# Altium project Module Board.PrjPcb (part 2 of 2)

## Sheet ESP_32.SchDoc
size A4; SheetNumber: 2; SheetTotal: 6
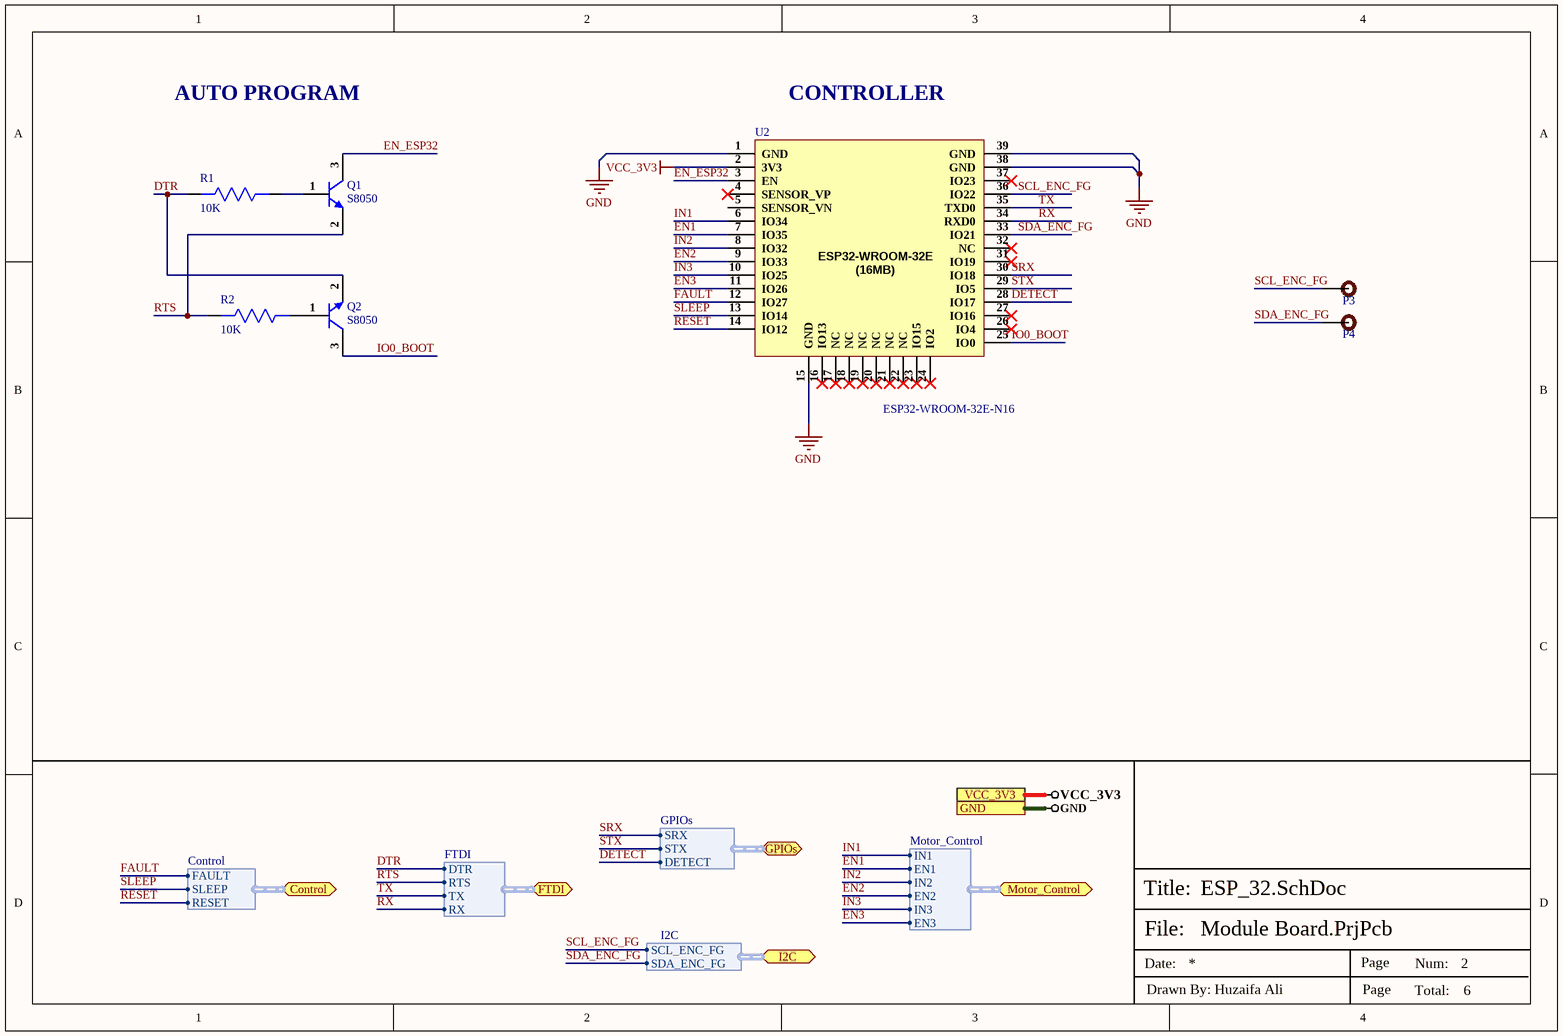
[diagram p3: ESP_32.SchDoc]

### Parts
P3  TEST POINT  [Test-point]  (value not drawn)
P4  TEST POINT  [Test-point]  (value not drawn)
Q1  S8050  [SOT-23]
Q2  S8050  [SOT-23]
R1  10K  [Res-0603]
R2  10K  [Res-0603]
U2  ESP32-WROOM-32E-N16  [38-SMD Module]

### Ports
Control (bidir, harness Control), FTDI (bidir, harness FTDI), GND, GPIOs (bidir, harness GPIOs), I2C (bidir, harness I2C), Motor_Control (bidir, harness Motor_Control), VCC_3V3

### Harnesses
Motor_Control: IN1, EN1, IN2, EN2, IN3, EN3
Control: FAULT, SLEEP, RESET
FTDI: DTR, TX, RX, RTS
I2C: SCL_ENC_FG, SDA_ENC_FG
GPIOs: SRX, STX, DETECT

### Nets
GND: U2.1(GND) U2.15(GND) U2.38(GND) U2.39(GND) ; port GND
VCC_3V3: U2.2(3V3) ; port VCC_3V3
DETECT: U2.28(IO17) ; port GPIOs.DETECT
DTR: Q2.2(E) R1.2 ; port FTDI.DTR
EN1: U2.7(IO35) ; port Motor_Control.EN1
EN2: U2.9(IO33) ; port Motor_Control.EN2
EN3: U2.11(IO26) ; port Motor_Control.EN3
EN_ESP32: Q1.3(C) U2.3(EN)
FAULT: U2.12(IO27) ; port Control.FAULT
IN1: U2.6(IO34) ; port Motor_Control.IN1
IN2: U2.8(IO32) ; port Motor_Control.IN2
IN3: U2.10(IO25) ; port Motor_Control.IN3
IO0_BOOT: Q2.3(C) U2.25(IO0)
RESET: U2.14(IO12) ; port Control.RESET
RTS: Q1.2(E) R2.2 ; port FTDI.RTS
RX: U2.34(RXD0) ; port FTDI.RX
SCL_ENC_FG: P3.1 U2.36(IO22) ; port I2C.SCL_ENC_FG
SDA_ENC_FG: P4.1 U2.33(IO21) ; port I2C.SDA_ENC_FG
SLEEP: U2.13(IO14) ; port Control.SLEEP
SRX: U2.30(IO18) ; port GPIOs.SRX
STX: U2.29(IO5) ; port GPIOs.STX
TX: U2.35(TXD0) ; port FTDI.TX
NetQ1_1: Q1.1(B) R1.1
NetQ2_1: Q2.1(B) R2.1

Not connected (* = marked no-connect by the designer): U2 4(SENSOR_VP)* 5(SENSOR_VN) 16(IO13)* 17(NC)* 18(NC)* 19(NC)* 20(NC)* 21(NC)* 22(NC)* 23(IO15)* 24(IO2)* 26(IO4)* 27(IO16)* 31(IO19)* 32(NC)* 37(IO23)*

### Notes on the sheet
- AUTO PROGRAM
- (near U2) CONTROLLER
- File:
- Title:
- Date:
- Page
- Num:
- Total:
- Drawn By: Huzaifa Ali
- (in symbol ESP32-WROOM-32E-N16) ESP32-WROOM-32E (16MB) /

### Library data of the parts
P3 P4 = TEST POINT: Test Point ON
Q1 Q2 = S8050: Trans Gp Bjt NPN 25V 1.5A 300MW 3-PIN SOT-23 T/r; Manufacturer: Comchip; Manufacturer Part Number: SS8050-G; Collector Emitter Voltage (VCEO): 400mV; Transition Frequency: 100MHz; Supplier 1: Arrow Electronics; RoHS: Yes; Stock 1: 2514; Pricing 1: 1=0.26480, 10=0.19960, 25=0.19760, 50=0.19590, 100=0.09990, 250=0.09890, 500=0.07670, 1000=0.05180 (USD); Mount: Surface Mount; Case/Package: TO-236-3; Packaging: Tape and Reel; Max Power Dissipation: 300mW; Max Collector Current: 1.5A; Collector Emitter Breakdown Voltage: 25V; Max Breakdown Voltage: 25V; ComponentLink1URL: http://www.comchiptech.com/admin/files/product/SS8050-G RevA181526.pdf?src-supplier=Digi-Key; ComponentLink1Description: http://www.comchiptech.com/admin/files/product/SS8050-G RevA181526.pdf?src-supplier=Digi-Key; ComponentLink2URL: http://www.comchiptech.com/cms/UserFiles/SS8050-G%20RevA181526.pdf?src-supplier=Digi-Key; ComponentLink2Description: http://www.comchiptech.com/cms/UserFiles/SS8050-G%20RevA181526.pdf?src-supplier=Digi-Key; Supplier Part Number 1: SS8050-G; LCSC Part Number: C105433
R1 R2 = AC0603JR-0710KL: RES SMD 10K OHM 5% 1/10W 0603; Manufacturer: Yageo; Voltage Rating: 50V; Resistance: 10kR; Power Rating: 100mW; Temperature Coefficient: 100ppm/°C; Supplier 1: Future Electronics; Manufacturer Part Number: AC0603JR-0710KL; RoHS: Yes; Category: Chip SMD Resistors; Stock 1: 1533000; Pricing 1: 5000=0.00540 (USD); Case/Package: 0603; Case Code (Imperial): 0603; Case Code (Metric): 1608; Size Code: 0603; Min Operating Temperature: -55°C; Max Operating Temperature: 155°C; Packaging: Tape and Reel; Tolerance: 5%; Package Quantity: 1; Resistor Type: Thick Film; Termination: SMD/SMT; Number of Terminations: 2; Max Power Dissipation: 100mW; Features: Moisture Resistant,Automotive AEC-Q200,Anti-Sulfur; Series: AC; Construction: Rectangular; Length: 0.063inch; Width: 0.031inch; Height: 0.022inch; Depth: 0.8mm; Military Standard: Not; Lead Free: Lead Free; RoHS Compliant: Yes; ComponentLink1URL: https://datasheet.ciiva.com/5562/pyu-ac-51-rohs-l-2-5562553.pdf?src-supplier=Mouser; ComponentLink1Description: https://datasheet.ciiva.com/5562/pyu-ac-51-rohs-l-2-5562553.pdf?src-supplier=Mouser; Supplier Part Number 1: 1029044; LCSC Part Number: C140867
U2 = ESP32-WROOM-32E-N16: SMD38,18x25.5x3.1 WiFi Modules ROHS; Manufacturer: Espressif Systems; Item Type: IC; Supplier 1: Digi-Key; Manufacturer Part Number: ESP32-WROOM-32E-N16; RoHS: No; Category: Uncategorized; Stock 1: 16240; Pricing 1: 1=3.60000 (USD); LCSC Part Number: C701343; Supplier Part Number 1: 1965-ESP32-WROOM-32E-N16CT-ND

## Sheet Connectors_Headers.SchDoc
size A4; SheetNumber: 3; SheetTotal: 6
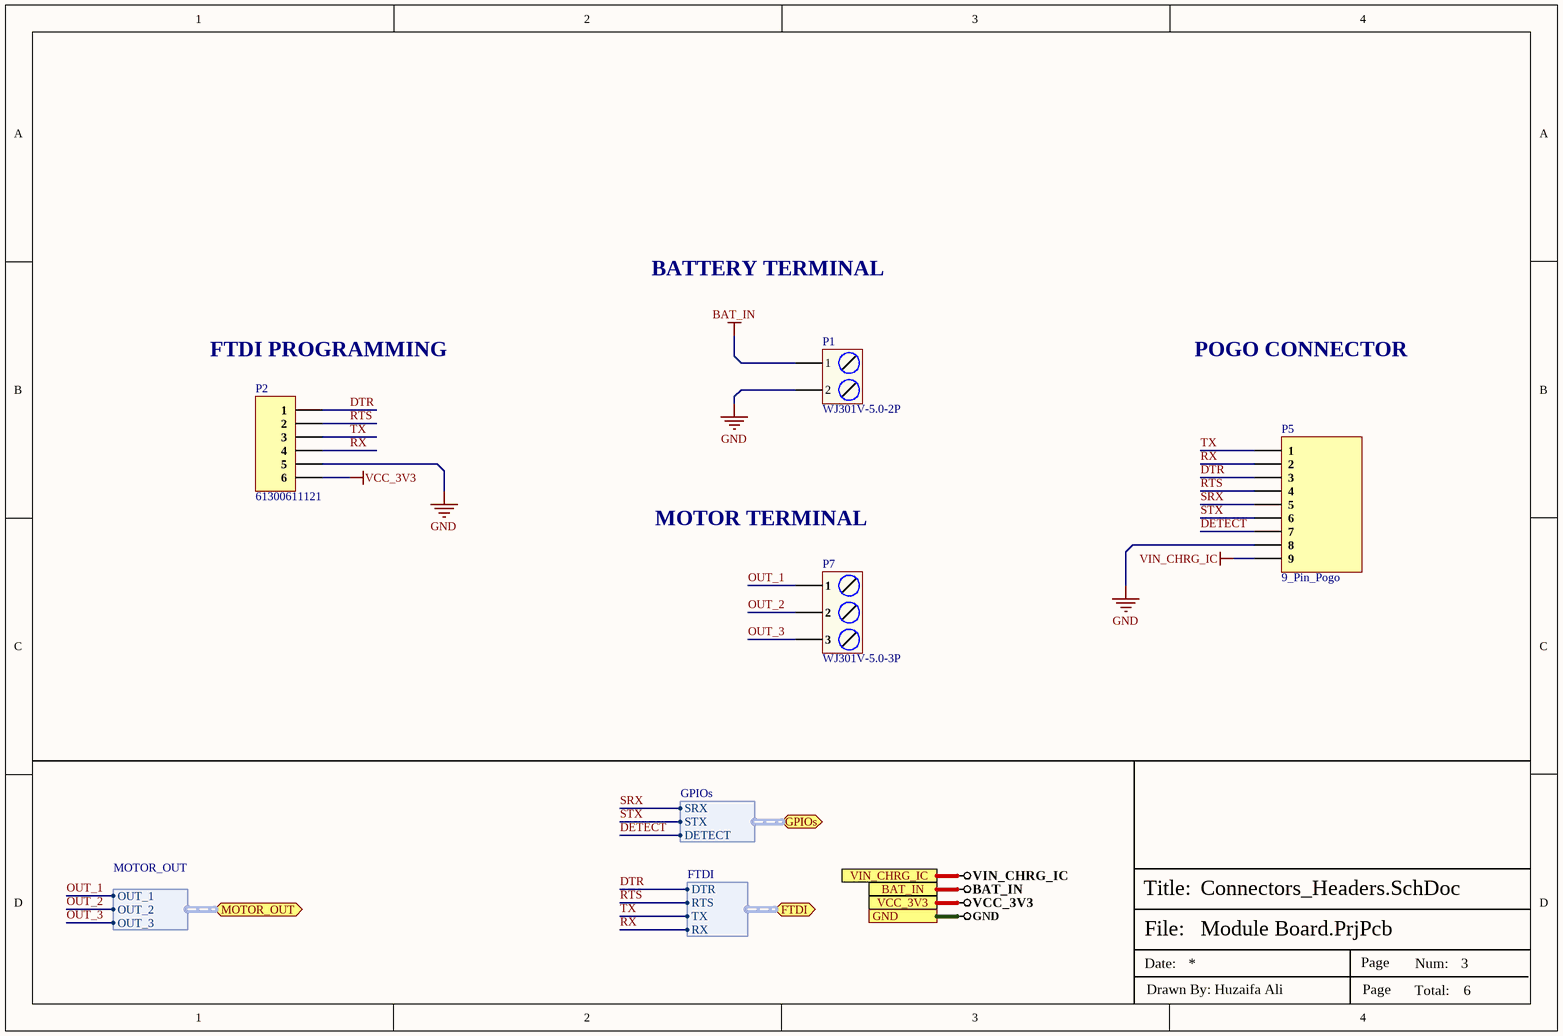
[diagram p4: Connectors_Headers.SchDoc]

### Parts
P1  WJ301V-5.0-2P  [WJ301V-5.0-2P]
P2  61300611121  [HDR1X6_]
P5  9_Pin_Pogo  [9_Pin_Pogo]
P7  WJ301V-5.0-3P  [WJ301V-5.0-3P]

### Ports
BAT_IN, FTDI (bidir, harness FTDI), GND, GPIOs (bidir, harness GPIOs), MOTOR_OUT (bidir, harness MOTOR_OUT), VCC_3V3, VIN_CHRG_IC

### Harnesses
FTDI: DTR, TX, RX, RTS
MOTOR_OUT: OUT_1, OUT_2, OUT_3
GPIOs: SRX, STX, DETECT

### Nets
BAT_IN: P1.1 ; port BAT_IN
GND: P1.2 P2.5 P5.8 ; port GND
VCC_3V3: P2.6 ; port VCC_3V3
VIN_CHRG_IC: P5.9 ; port VIN_CHRG_IC
DETECT: P5.7 ; port GPIOs.DETECT
DTR: P2.1 P5.3 ; port FTDI.DTR
OUT_1: P7.1 ; port MOTOR_OUT.OUT_1
OUT_2: P7.2 ; port MOTOR_OUT.OUT_2
OUT_3: P7.3 ; port MOTOR_OUT.OUT_3
RTS: P2.2 P5.4 ; port FTDI.RTS
RX: P2.4 P5.2 ; port FTDI.RX
SRX: P5.5 ; port GPIOs.SRX
STX: P5.6 ; port GPIOs.STX
TX: P2.3 P5.1 ; port FTDI.TX

### Notes on the sheet
- BATTERY TERMINAL
- (near P2) FTDI PROGRAMMING
- POGO CONNECTOR
- MOTOR TERMINAL
- File:
- Title:
- Date:
- Page
- Num:
- Total:
- Drawn By: Huzaifa Ali

### Library data of the parts
P1 = WJ301V-5.0-2P: P=5.0mm Screw terminal RoHS; Manufacturer: Ningbo Kangnex Elec; Value: Custom; Manufacturer Part No: WJ301V-5.0-2P; Package: Custom
P2 = 61300611121: CONN HEADER 6 POS 2.54; Manufacturer: Wurth Electronics; Current Rating: 3A; Voltage Rating: 250V; Number of Positions: 6; Gender: Male; Connector Type: Male Pin; Pitch: 0.1inch; Supplier 1: Newark; Manufacturer Part Number: 61300611121; RoHS: Yes; Category: Headers and Wire Housings; Stock 1: 4996; Pricing 1: 1=0.34000, 10=0.28900, 25=0.24000, 50=0.20100, 100=0.18200 (USD); Mount: Through Hole; Contact Plating: Gold; Contact Material: Copper Alloy,Copper; Housing Material: PBT; Color: Black; Min Operating Temperature: -40°C; Max Operating Temperature: 125°C; Number of Rows: 1; Contact Gender: Male; Packaging: Bulk; Termination: Through Hole; Number of Contacts: 6; Series: WR-PHD; Contact Type: Male Pin; Contact Mating Length: 0.236inch; REACH SVHC: Unknown; Lead Free: Lead Free; RoHS Compliant: Yes; ComponentLink1URL: http://www.mouser.com/ds/2/445/6130xx11121-538006.pdf?src-supplier=Mouser; ComponentLink1Description: http://www.mouser.com/ds/2/445/6130xx11121-538006.pdf?src-supplier=Mouser; ComponentLink2URL: http://www.farnell.com/cad/1737268.pdf?src-supplier=Element14; ComponentLink2Description: http://www.farnell.com/cad/1737268.pdf?src-supplier=Element14; ComponentLink3URL: https://katalog.we-online.de/em/datasheet/6130xx11121.pdf?src-supplier=Digi-Key; ComponentLink3Description: https://katalog.we-online.de/em/datasheet/6130xx11121.pdf?src-supplier=Digi-Key; Supplier Part Number 1: 20X0957
P7 = WJ301V-5.0-3P: P=5.0mm Screw terminal RoHS; Manufacturer: Ningbo Kangnex Elec; Manufacturer Part Number: WJ301V-5.0-3P; Package: Custom; LCSC Part Number: C8483; ComponentLink1Description: LCSC; ComponentLink1URL: https://www.lcsc.com/product-detail/Screw-terminal_Ningbo-Kangnex-Elec-WJ301V-5-0-3P_C8483.html

## Sheet Driver.SchDoc
size A4; SheetNumber: 2; SheetTotal: 6
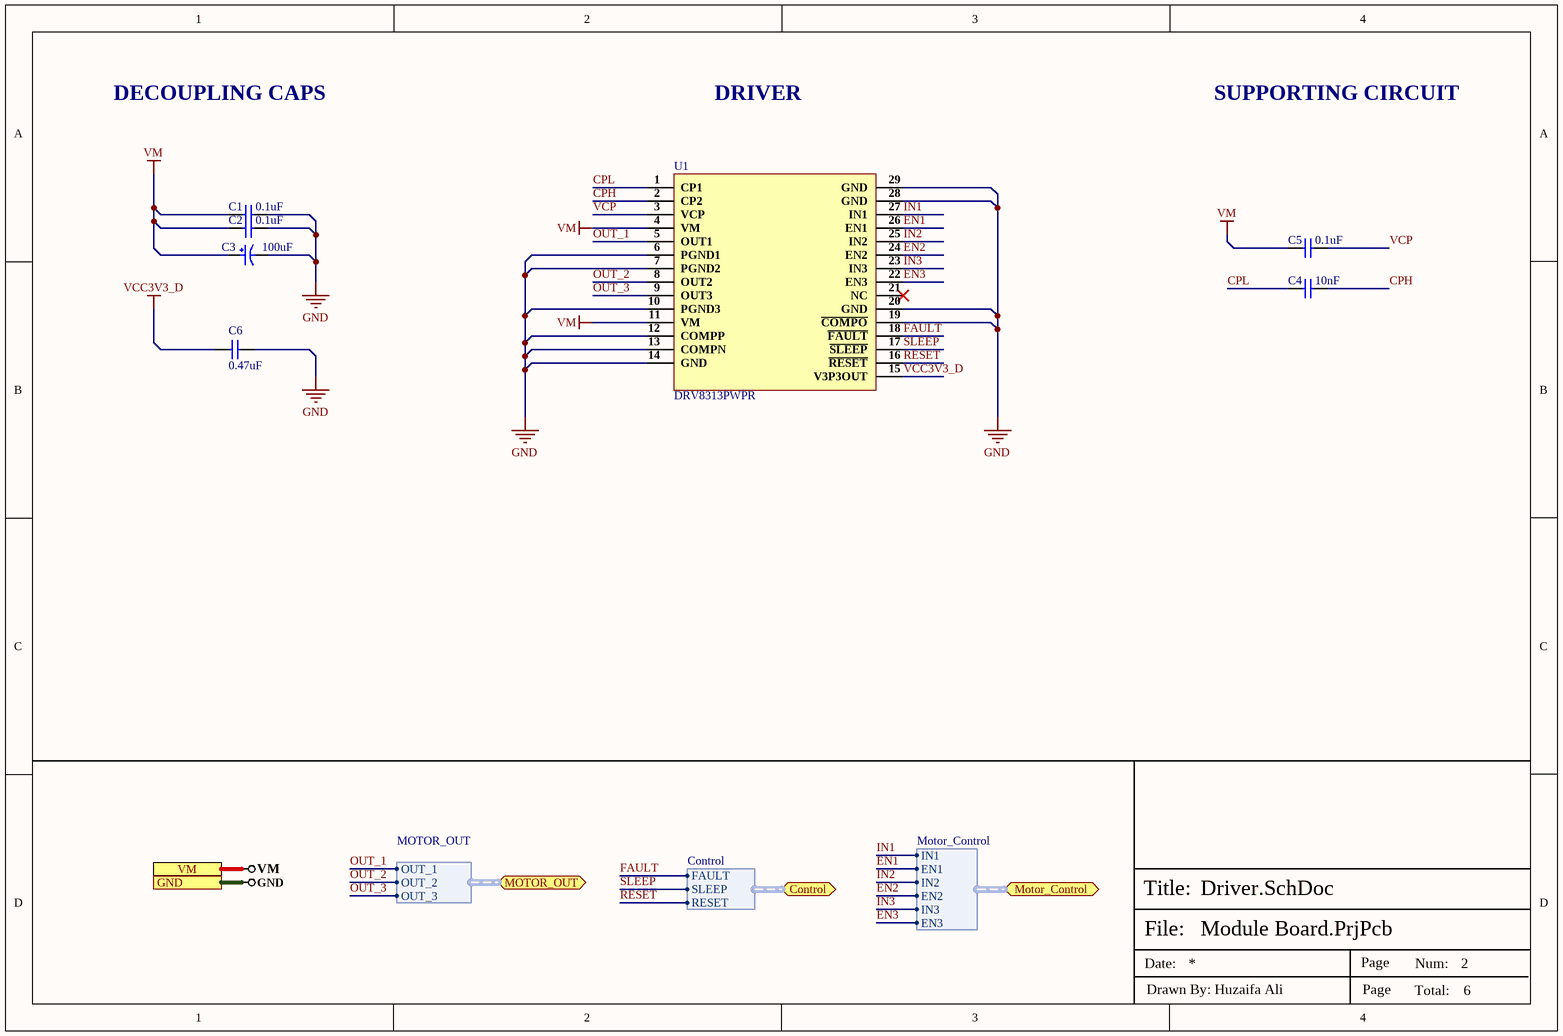
[diagram p5: Driver.SchDoc]

### Parts
C1  0.1uF  [CAP-0603]
C2  0.1uF  [CAP-0603]
C3  100uF  [UWT1H101MNL1GS_]
C4  10nF  [Cap-0603]
C5  0.1uF  [CAP-0603]
C6  0.47uF  [Cap-0603]
U1  DRV8313PWPR  [28-HTSSOP_]

### Ports
Control (bidir, harness Control), GND, Motor_Control (bidir, harness Motor_Control), MOTOR_OUT (bidir, harness MOTOR_OUT), VM

### Harnesses
Motor_Control: IN1, EN1, IN2, EN2, IN3, EN3
Control: FAULT, SLEEP, RESET
MOTOR_OUT: OUT_1, OUT_2, OUT_3

### Nets
GND: C1.2 C2.2 C3.2 C6.2 U1.6(PGND1) U1.7(PGND2) U1.10(PGND3) U1.12(COMPP) U1.13(COMPN) U1.14(GND) U1.19(~{COMPO}) U1.20(GND) U1.28(GND) U1.29(GND) ; port GND
VCC3V3_D: C6.1 U1.15(V3P3OUT)
VM: C1.1 C2.1 C3.1 C5.1 U1.4(VM) U1.11(VM) ; port VM
CPH: C4.2 U1.2(CP2)
CPL: C4.1 U1.1(CP1)
EN1: U1.26(EN1) ; port Motor_Control.EN1
EN2: U1.24(EN2) ; port Motor_Control.EN2
EN3: U1.22(EN3) ; port Motor_Control.EN3
FAULT: U1.18(~{FAULT}) ; port Control.FAULT
IN1: U1.27(IN1) ; port Motor_Control.IN1
IN2: U1.25(IN2) ; port Motor_Control.IN2
IN3: U1.23(IN3) ; port Motor_Control.IN3
OUT_1: U1.5(OUT1) ; port MOTOR_OUT.OUT_1
OUT_2: U1.8(OUT2) ; port MOTOR_OUT.OUT_2
OUT_3: U1.9(OUT3) ; port MOTOR_OUT.OUT_3
RESET: U1.16(~{RESET}) ; port Control.RESET
SLEEP: U1.17(~{SLEEP}) ; port Control.SLEEP
VCP: C5.2 U1.3(VCP)

Not connected (* = marked no-connect by the designer): U1 21(NC)*

### Notes on the sheet
- DECOUPLING CAPS
- DRIVER
- SUPPORTING CIRCUIT
- File:
- Title:
- Date:
- Page
- Num:
- Total:
- Drawn By: Huzaifa Ali

### Library data of the parts
C1 C2 C5 = CL10B104KB8NNNL: CAP CER 0.1UF 50V X7R 0603; Manufacturer: Samsung; Capacitance: 100nF; Tolerance: 10%; Supplier 1: Digi-Key; Manufacturer Part Number: CL10B104KB8NNNL; Stock 1: 3731229; Pricing 1: 1=0.1, 10=0.03, 50=0.0164, 100=0.0134, 500=0.00958, 1000=0.00753, 2500=0.00684, 5000=0.0063 (USD); Mount: Surface Mount; Case/Package: 0603; Min Operating Temperature: -55°C; Max Operating Temperature: 125°C; Dielectric: X7R; Packaging: Tape and Reel; Package Quantity: 15000; Voltage Rating: 50V; Voltage Rating (DC): 50V; Series: CL; Construction: Flat; Length: 1.6mm; Width: 0.031inch; Height: 0.8mm; Thickness: 0.035inch; Depth: 0.8mm; Radiation Hardening: No; RoHS Compliant: Yes; ComponentLink1URL: https://www.verical.com/server-webapp/html/getDatasheet?partID=357523&src-supplier=Verical; ComponentLink1Description: https://www.verical.com/server-webapp/html/getDatasheet?partID=357523&src-supplier=Verical; ComponentLink2URL: https://media.digikey.com/pdf/Data%20Sheets/Samsung%20PDFs/CL_Series_MLCC_ds.pdf?src-supplier=Digi-Key; ComponentLink2Description: https://media.digikey.com/pdf/Data%20Sheets/Samsung%20PDFs/CL_Series_MLCC_ds.pdf?src-supplier=Digi-Key; Supplier Part Number 1: 1276-CL10B104KB8NNNLCT-ND; LCSC Part Number: C913912
C3 = UWT1H101MNL1GS: CAP ALUM 100UF 20% 50V SMD; Manufacturer: Nichicon; Dielectric Material: Aluminium; Ripple Current: 140mA; Leakage Current: 3uA; Life (Hours): 1000Hour; Dissipation Factor: 0.14%; Supplier 1: Digi-Key; Manufacturer Part Number: UWT1H101MNL1GS; Stock 1: 24169; Pricing 1: 1=0.57, 10=0.405, 50=0.3058, 100=0.2664 (USD); Mount: Surface Mount; Case/Package: Radial; Number of Pins: 2; Min Operating Temperature: -55°C; Max Operating Temperature: 105°C; Capacitance: 100uF; Tolerance: 20%; Package Quantity: 500; Voltage Rating: 50V; Packaging: Tape and Reel; Ripple Current (AC): 140mA; Voltage Rating (DC): 50V; Termination: SMD/SMT; Voltage: 50V; Series: WT; Construction: Cylindrical; Diameter: 8mm; Length: 10mm; Height: 10mm; Height - Seated (Max): 0.413inch; Radiation Hardening: No; REACH SVHC: No SVHC; Lead Free: Lead Free; RoHS Compliant: Yes; ComponentLink1URL: http://www.farnell.com/datasheets/2100058.pdf?src-supplier=Element14; ComponentLink1Description: http://www.farnell.com/datasheets/2100058.pdf?src-supplier=Element14; ComponentLink2URL: http://www.farnell.com/datasheets/2576809.pdf?src-supplier=Element14; ComponentLink2Description: http://www.farnell.com/datasheets/2576809.pdf?src-supplier=Element14; ComponentLink3URL: http://www.nichicon.co.jp/english/products/pdfs/e-ch_ref.pdf?src-supplier=Digi-Key; ComponentLink3Description: http://www.nichicon.co.jp/english/products/pdfs/e-ch_ref.pdf?src-supplier=Digi-Key; ComponentLink4URL: http://www.mouser.com/ds/2/293/e-wt-30307.pdf?src-supplier=Mouser; ComponentLink4Description: http://www.mouser.com/ds/2/293/e-wt-30307.pdf?src-supplier=Mouser; ComponentLink5URL: http://uk.rs-online.com/webdocs/13ec/0900766b813ecfdc.pdf?src-supplier=RSComponents; ComponentLink5Description: http://uk.rs-online.com/webdocs/13ec/0900766b813ecfdc.pdf?src-supplier=RSComponents; ComponentLink6URL: http://www.nichicon.co.jp/english/products/pdfs/e-wt.pdf?src-supplier=Avnet; ComponentLink6Description: http://www.nichicon.co.jp/english/products/pdfs/e-wt.pdf?src-supplier=Avnet; ComponentLink7URL: http://products.nichicon.co.jp/en/pdf/XJA043/e-wt.pdf?src-supplier=Future+Electronics; ComponentLink7Description: http://products.nichicon.co.jp/en/pdf/XJA043/e-wt.pdf?src-supplier=Future+Electronics; ComponentLink8URL: http://www.nichicon.co.jp/english/products/pdfs/e-wt.pdf?src-supplier=Avnet+Europe; ComponentLink8Description: http://www.nichicon.co.jp/english/products/pdfs/e-wt.pdf?src-supplier=Avnet+Europe; Supplier Part Number 1: 493-2226-1-ND; LCSC Part Number: C445063
C4 = AC0603KRX7R0BB103: 100V 10nF X7R ±10% 0603 Multilayer Ceramic Capacitors MLCC - SMD/SMT ROHS
C6 = CL10A474KB8NNNC: CAP CER 0.47UF 50V X5R 0603; Manufacturer: Samsung; Tolerance: 10%; Capacitance: 470nF; Supplier 1: Arrow Electronics; Manufacturer Part Number: CL10A474KB8NNNC; RoHS: Yes; Category: Ceramic Capacitors; Stock 1: 196000; Pricing 1: 200000=0.04290, 300000=0.04250, 400000=0.04210, 500000=0.04170, 1000000=0.04120, 2000000=0.04080 (USD); Mount: Surface Mount; Case/Package: 0603; Case Code (Metric): 1608; Case Code (Imperial): 0603; Min Operating Temperature: -55°C; Max Operating Temperature: 85°C; Packaging: Tape and Reel; Package Quantity: 1; Voltage Rating: 50V; Dielectric: X5R; Series: CL; Construction: Flat; Voltage Rating (DC): 50V; Length: 1.6mm; Width: 0.031inch; Height: 0.8mm; Thickness: 0.035inch; Depth: 0.8mm; Radiation Hardening: No; RoHS Compliant: Yes; Lead Free: Lead Free; ComponentLink1URL: https://datasheet.ciiva.com/25798/cl10a474kb8nnnc-25798516.pdf?src-supplier=Digi-Key; ComponentLink1Description: https://datasheet.ciiva.com/25798/cl10a474kb8nnnc-25798516.pdf?src-supplier=Digi-Key; ComponentLink2URL: https://datasheet.ciiva.com/15195/getdatasheetpartid-353290-15195713.pdf?src-supplier=Verical; ComponentLink2Description: https://datasheet.ciiva.com/15195/getdatasheetpartid-353290-15195713.pdf?src-supplier=Verical; Supplier Part Number 1: CL10A474KB8NNNC; LCSC Part Number: C170149
U1 = DRV8313PWPR: Motor Driver Power MOSFET Parallel 28-HTSSOP; Manufacturer: Texas Instruments; Number of Outputs: 1; Output Current: 1.75A; Min Supply Voltage: 8V; Max Supply Voltage: 60V; Logic Function: AND GATE; Supplier 1: Digi-Key; Manufacturer Part Number: DRV8313PWPR; RoHS: Yes; Category: Motor Drivers; Stock 1: 1980; Pricing 1: 1=4.14000, 10=3.71900, 25=3.51560, 100=3.04680, 250=2.89052, 500=2.59366, 1000=2.35840 (USD); Mount: Surface Mount; Case/Package: HTSSOP; Number of Pins: 28; Min Operating Temperature: -40°C; Max Operating Temperature: 125°C; Packaging: Tape and Reel; Package Quantity: 2000; Series: -; Interface: Parallel; Lead Free: Lead Free; RoHS Compliant: Yes; ComponentLink1URL: https://datasheet.ciiva.com/24105/slvsba5a-261520-24105611.pdf?src-supplier=Mouser; ComponentLink1Description: https://datasheet.ciiva.com/24105/slvsba5a-261520-24105611.pdf?src-supplier=Mouser; ComponentLink2URL: https://datasheet.ciiva.com/6607/drv8313-6607795.pdf?src-supplier=Digi-Key; ComponentLink2Description: https://datasheet.ciiva.com/6607/drv8313-6607795.pdf?src-supplier=Digi-Key; LCSC Part  Number: C92482; Supplier Part Number 1: 296-40072-1-ND

## Nets that join several sheets
BAT_IN: Power (8 pins), Connectors_Headers (P1.1)
GND: Power (40 pins), Encoder (C7.2 D3.2 U3.4), ESP_32 (U2.1 U2.15 U2.38 U2.39), Connectors_Headers (P1.2 P2.5 P5.8), Driver (14 pins)
VCC_3V3: Power (C12.1 SB4.2), Encoder (6 pins), ESP_32 (U2.2), Connectors_Headers (P2.6)
VIN_CHRG_IC: Power (7 pins), Connectors_Headers (P5.9)
VM: Power (C10.1 R7.1 SB3.2), Driver (6 pins)
DETECT: ESP_32 (U2.28), Connectors_Headers (P5.7)
DTR: ESP_32 (Q2.2 R1.2), Connectors_Headers (P2.1 P5.3)
EN1: ESP_32 (U2.7), Driver (U1.26)
EN2: ESP_32 (U2.9), Driver (U1.24)
EN3: ESP_32 (U2.11), Driver (U1.22)
FAULT: ESP_32 (U2.12), Driver (U1.18)
IN1: ESP_32 (U2.6), Driver (U1.27)
IN2: ESP_32 (U2.8), Driver (U1.25)
IN3: ESP_32 (U2.10), Driver (U1.23)
OUT_1: Connectors_Headers (P7.1), Driver (U1.5)
OUT_2: Connectors_Headers (P7.2), Driver (U1.8)
OUT_3: Connectors_Headers (P7.3), Driver (U1.9)
RESET: ESP_32 (U2.14), Driver (U1.16)
RTS: ESP_32 (Q1.2 R2.2), Connectors_Headers (P2.2 P5.4)
RX: ESP_32 (U2.34), Connectors_Headers (P2.4 P5.2)
SCL_ENC_FG: Power (U10.7), Encoder (R10.1 U3.7), ESP_32 (P3.1 U2.36)
SDA_ENC_FG: Power (U10.8), Encoder (R11.1 U3.6), ESP_32 (P4.1 U2.33)
SLEEP: ESP_32 (U2.13), Driver (U1.17)
SRX: ESP_32 (U2.30), Connectors_Headers (P5.5)
STX: ESP_32 (U2.29), Connectors_Headers (P5.6)
TX: ESP_32 (U2.35), Connectors_Headers (P2.3 P5.1)